# Altium schematic sheet RS485_RS232_Sheet.SchDoc
size 420 x 297 mm; SheetNumber: 7; SheetTotal: 9
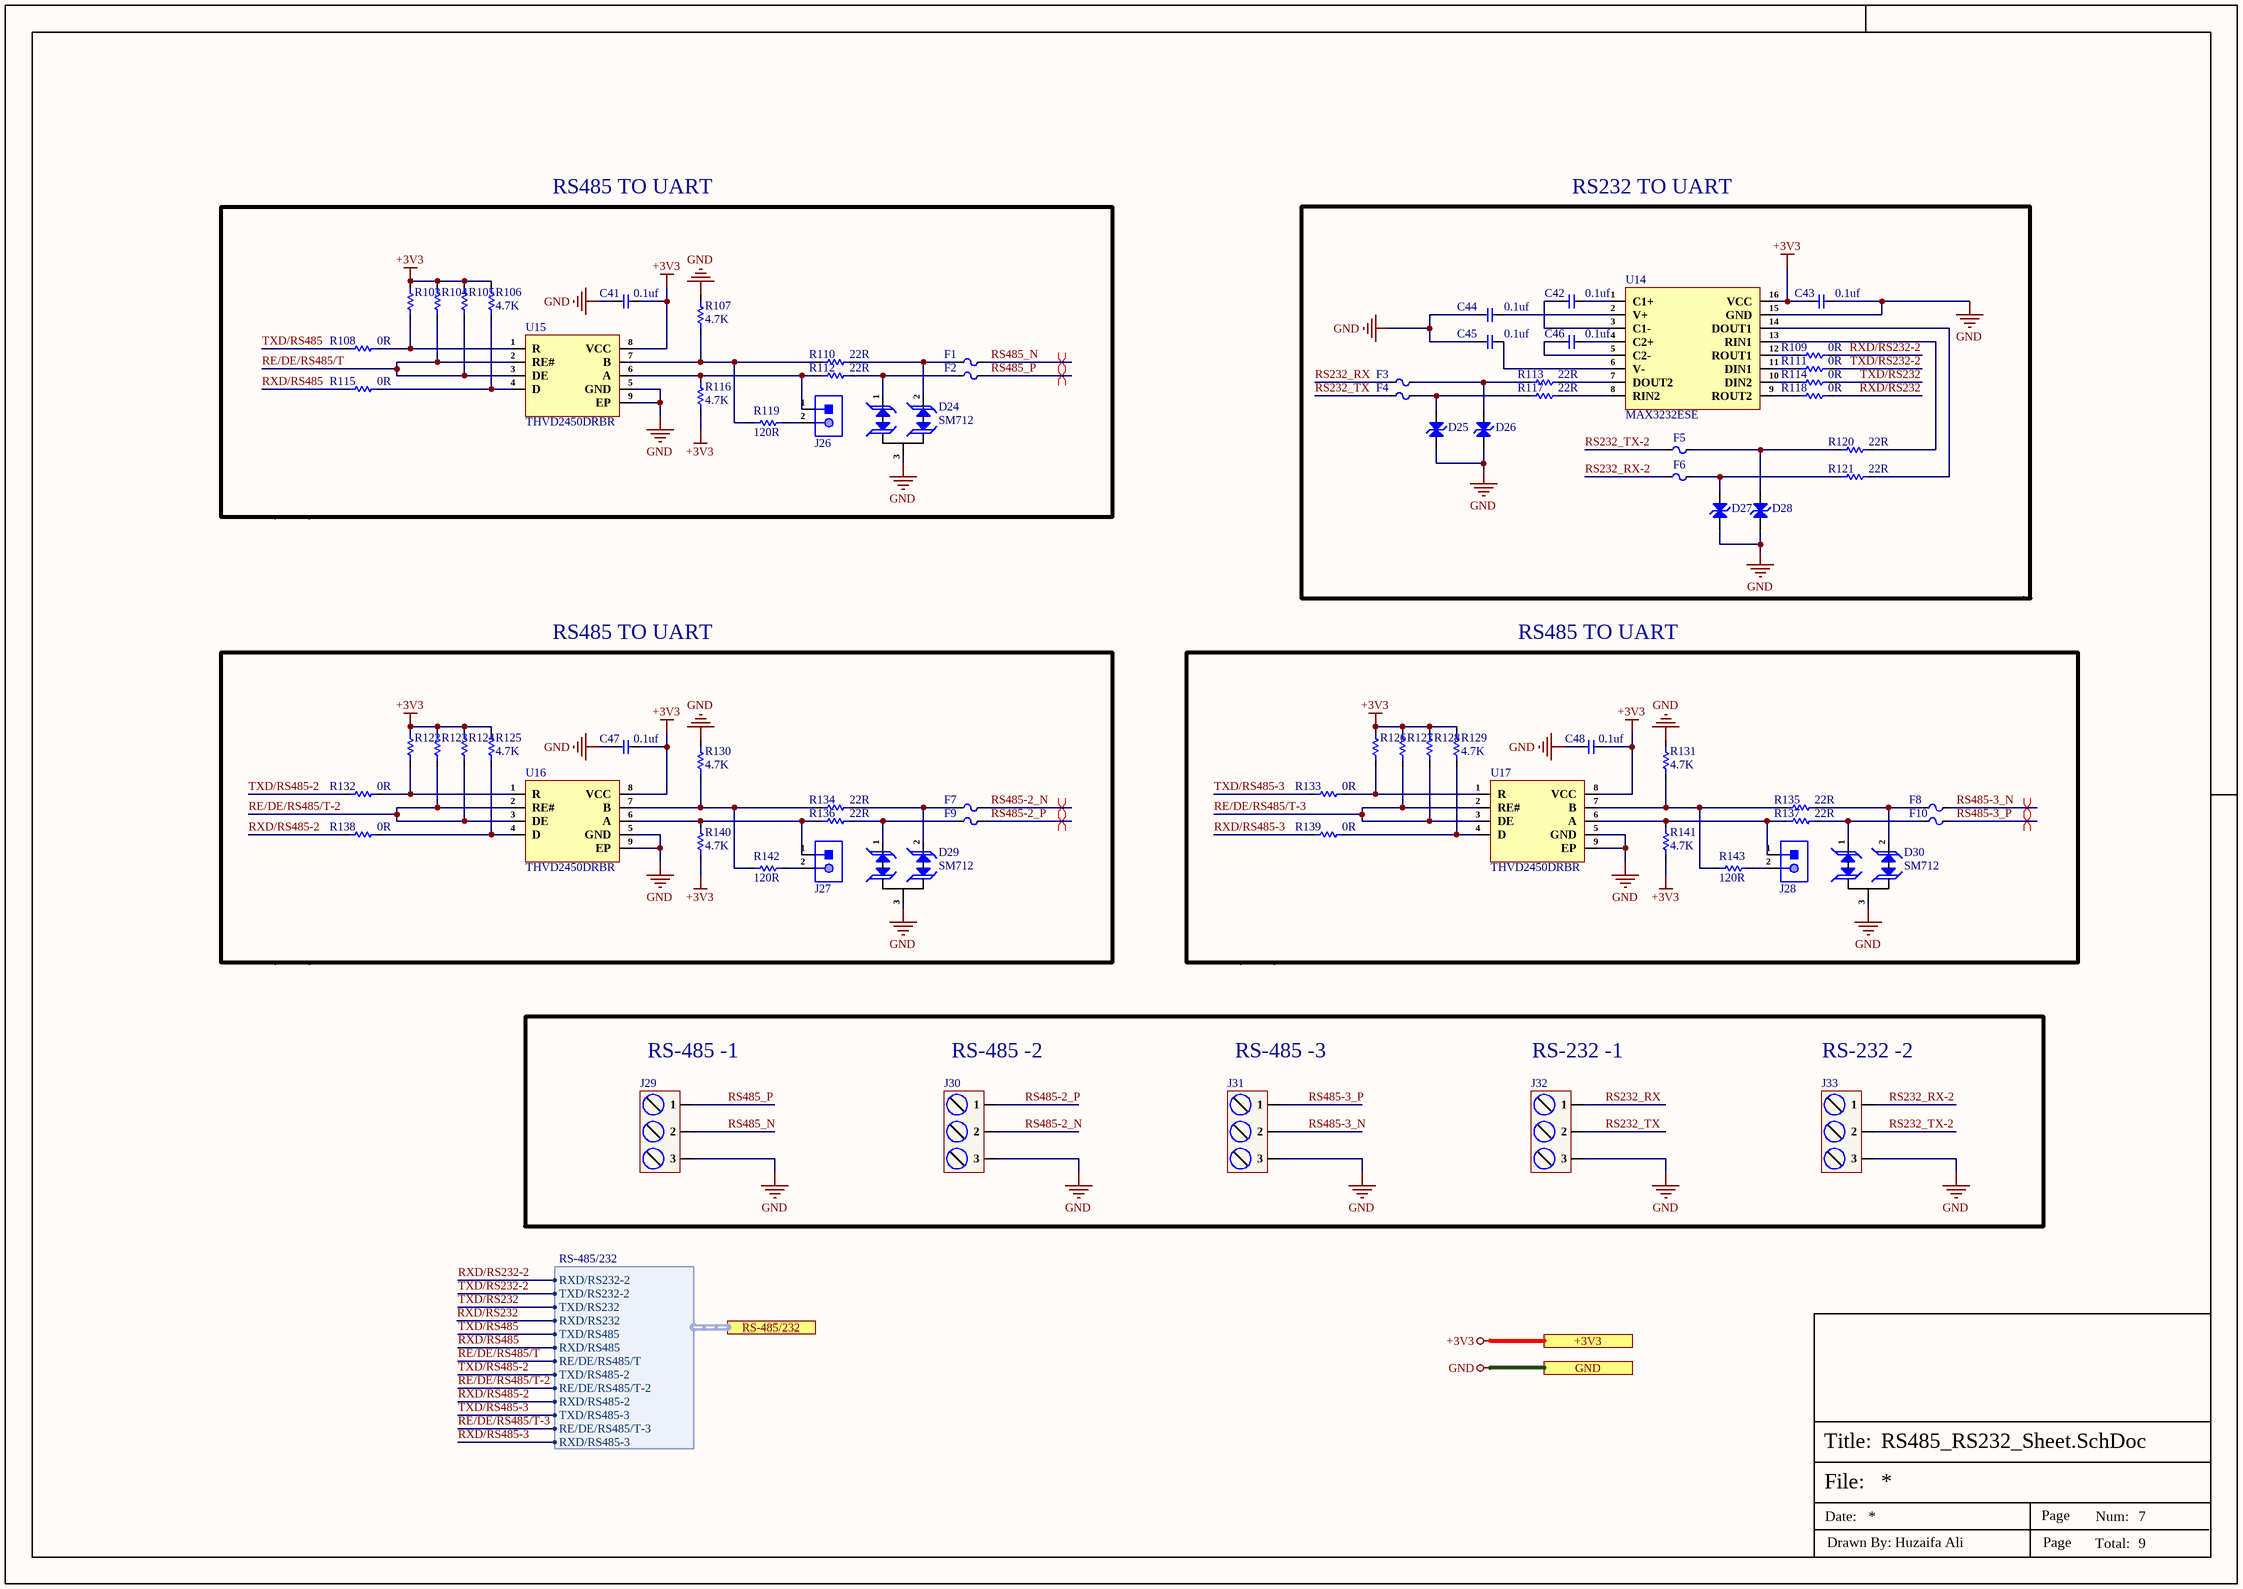
[diagram p0: RS485_RS232_Sheet.SchDoc]

## Parts
C41  0.1uf  [Cap-0402]
C42  0.1uf  [Cap-0402]
C43  0.1uf  [Cap-0402]
C44  0.1uf  [Cap-0402]
C45  0.1uf  [Cap-0402]
C46  0.1uf  [Cap-0402]
C47  0.1uf  [Cap-0402]
C48  0.1uf  [Cap-0402]
D24  SM712  [SOT-23]
D25  SMBJ8.0CA  [SMB Bi Directional]  (value not drawn)
D26  SMBJ8.0CA  [SMB Bi Directional]  (value not drawn)
D27  SMBJ8.0CA  [SMB Bi Directional]  (value not drawn)
D28  SMBJ8.0CA  [SMB Bi Directional]  (value not drawn)
D29  SM712  [SOT-23]
D30  SM712  [SOT-23]
F1  MF-MSMF010-2  [Fuse-1812_]  (value not drawn)
F2  MF-MSMF010-2  [Fuse-1812_]  (value not drawn)
F3  MF-MSMF010-2  [Fuse-1812_]  (value not drawn)
F4  MF-MSMF010-2  [Fuse-1812_]  (value not drawn)
F5  SMD0805P020TF  [Fuse-0805]  (value not drawn)
F6  SMD0805P020TF  [Fuse-0805]  (value not drawn)
F7  MF-MSMF010-2  [Fuse-1812_]  (value not drawn)
F8  MF-MSMF010-2  [Fuse-1812_]  (value not drawn)
F9  MF-MSMF010-2  [Fuse-1812_]  (value not drawn)
F10  MF-MSMF010-2  [Fuse-1812_]  (value not drawn)
J26  X6511WV-02H-C60D30  [HDR1X2_]  (value not drawn)
J27  X6511WV-02H-C60D30  [HDR1X2_]  (value not drawn)
J28  X6511WV-02H-C60D30  [HDR1X2_]  (value not drawn)
J29  DB128L-5.08-3P-BK-S  [DB128L-5.08-3P-BK-S]  (value not drawn)
J30  DB128L-5.08-3P-BK-S  [DB128L-5.08-3P-BK-S]  (value not drawn)
J31  DB128L-5.08-3P-BK-S  [DB128L-5.08-3P-BK-S]  (value not drawn)
J32  DB128L-5.08-3P-BK-S  [DB128L-5.08-3P-BK-S]  (value not drawn)
J33  DB128L-5.08-3P-BK-S  [DB128L-5.08-3P-BK-S]  (value not drawn)
R103  4.7K  [Res-0402]  (value not drawn)
R104  4.7K  [Res-0402]  (value not drawn)
R105  4.7K  [Res-0402]  (value not drawn)
R106  4.7K  [Res-0402]
R107  4.7K  [Res-0402]
R108  0R  [Res-0402]
R109  0R  [Res-0402]
R110  22R  [Res-0201]
R111  0R  [Res-0402]
R112  22R  [Res-0201]
R113  22R  [Res-0201]
R114  0R  [Res-0402]
R115  0R  [Res-0402]
R116  4.7K  [Res-0402]
R117  22R  [Res-0201]
R118  0R  [Res-0402]
R119  120R  [Res-0603]
R120  22R  [Res-0201]
R121  22R  [Res-0201]
R122  4.7K  [Res-0402]  (value not drawn)
R123  4.7K  [Res-0402]  (value not drawn)
R124  4.7K  [Res-0402]  (value not drawn)
R125  4.7K  [Res-0402]
R126  4.7K  [Res-0402]  (value not drawn)
R127  4.7K  [Res-0402]  (value not drawn)
R128  4.7K  [Res-0402]  (value not drawn)
R129  4.7K  [Res-0402]
R130  4.7K  [Res-0402]
R131  4.7K  [Res-0402]
R132  0R  [Res-0402]
R133  0R  [Res-0402]
R134  22R  [Res-0201]
R135  22R  [Res-0201]
R136  22R  [Res-0201]
R137  22R  [Res-0201]
R138  0R  [Res-0402]
R139  0R  [Res-0402]
R140  4.7K  [Res-0402]
R141  4.7K  [Res-0402]
R142  120R  [Res-0603]
R143  120R  [Res-0603]
U14  MAX3232ESE  [SOP-16]
U15  THVD2450DRBR  [SON-8-EP(3x3)]
U16  THVD2450DRBR  [SON-8-EP(3x3)]
U17  THVD2450DRBR  [SON-8-EP(3x3)]

## Ports
+3V3 (see Top-Sheet[5B], CAN_Sheet[5D], ESP32_Sheet[5D], EtherCAT_Sheet[5D], Ethernet_Sheet[5D], Power_Sheet[5D], STM32_Sheet[5D], TFT_Display_Sheet[5D]), GND (see Top-Sheet[5B], CAN_Sheet[5D], ESP32_Sheet[5D], EtherCAT_Sheet[5D], Ethernet_Sheet[5D], Power_Sheet[5D], STM32_Sheet[5D], TFT_Display_Sheet[5D]), RS-485/232 (harness RS-485/232, see Top-Sheet[5B], STM32_Sheet[2D])

## Harnesses
RS-485/232: TXD/RS232, RXD/RS232, TXD/RS485, RXD/RS485, RE/DE/RS485/T, TXD/RS485-2, RE/DE/RS485/T-2, RXD/RS485-2, TXD/RS232-2, RXD/RS232-2, TXD/RS485-3, RE/DE/RS485/T-3, RXD/RS485-3

## Nets
+3V3: C41.2 C43.2 C47.2 C48.2 R103.2 R104.2 R105.2 R106.2 R116.1 R122.2 R123.2 R124.2 R125.2 R126.2 R127.2 R128.2 R129.2 R140.1 R141.1 U14.16(VCC) U15.8(VCC) U16.8(VCC) U17.8(VCC) ; port +3V3
GND: C41.1 C43.1 C44.1 C45.1 C47.1 C48.1 D24.3(GND) D25.1(A) D26.1(A) D27.1(A) D28.1(A) D29.3(GND) D30.3(GND) J29.3 J30.3 J31.3 J32.3 J33.3 R107.2 R130.2 R131.2 U14.15(GND) U15.5(GND) U15.9(EP) U16.5(GND) U16.9(EP) U17.5(GND) U17.9(EP) ; port GND
RE/DE/RS485/T: R104.1 R105.1 U15.2(RE#) U15.3(DE) ; port RS-485/232.RE/DE/RS485/T
RE/DE/RS485/T-2: R123.1 R124.1 U16.2(RE#) U16.3(DE) ; port RS-485/232.RE/DE/RS485/T-2
RE/DE/RS485/T-3: R127.1 R128.1 U17.2(RE#) U17.3(DE) ; port RS-485/232.RE/DE/RS485/T-3
RS232_RX: F3.1 J32.1
RS232_RX-2: F6.1 J33.1
RS232_TX: F4.1 J32.2
RS232_TX-2: F5.1 J33.2
RS485-2_N: F7.2 J30.2
RS485-2_P: F9.2 J30.1
RS485-3_N: F8.2 J31.2
RS485-3_P: F10.2 J31.1
RS485_N: F1.2 J29.2
RS485_P: F2.2 J29.1
RXD/RS232: R118.2 ; port RS-485/232.RXD/RS232
RXD/RS232-2: R109.2 ; port RS-485/232.RXD/RS232-2
RXD/RS485: R115.1 ; port RS-485/232.RXD/RS485
RXD/RS485-2: R138.1 ; port RS-485/232.RXD/RS485-2
RXD/RS485-3: R139.1 ; port RS-485/232.RXD/RS485-3
TXD/RS232: R114.2 ; port RS-485/232.TXD/RS232
TXD/RS232-2: R111.2 ; port RS-485/232.TXD/RS232-2
TXD/RS485: R108.1 ; port RS-485/232.TXD/RS485
TXD/RS485-2: R132.1 ; port RS-485/232.TXD/RS485-2
TXD/RS485-3: R133.1 ; port RS-485/232.TXD/RS485-3
NetC42_1: C42.1 U14.1(C1+)
NetC42_2: C42.2 U14.3(C1-)
NetC44_2: C44.2 U14.2(V+)
NetC45_2: C45.2 U14.6(V-)
NetC46_1: C46.1 U14.4(C2+)
NetC46_2: C46.2 U14.5(C2-)
NetD24_1: D24.1(I/O1) F2.1 R112.2
NetD24_2: D24.2(I/O2) F1.1 R110.2
NetD25_2: D25.2(A) F4.2 R117.1
NetD26_2: D26.2(A) F3.2 R113.1
NetD27_2: D27.2(A) F6.2 R121.1
NetD28_2: D28.2(A) F5.2 R120.1
NetD29_1: D29.1(I/O1) F9.1 R136.2
NetD29_2: D29.2(I/O2) F7.1 R134.2
NetD30_1: D30.1(I/O1) F10.1 R137.2
NetD30_2: D30.2(I/O2) F8.1 R135.2
NetJ26_1: J26.1 R112.1 R116.2 U15.6(A)
NetJ26_2: J26.2 R119.2
NetJ27_1: J27.1 R136.1 R140.2 U16.6(A)
NetJ27_2: J27.2 R142.2
NetJ28_1: J28.1 R137.1 R141.2 U17.6(A)
NetJ28_2: J28.2 R143.2
NetR103_1: R103.1 R108.2 U15.1(R)
NetR106_1: R106.1 R115.2 U15.4(D)
NetR107_1: R107.1 R110.1 R119.1 U15.7(B)
NetR109_1: R109.1 U14.12(ROUT1)
NetR111_1: R111.1 U14.11(DIN1)
NetR113_2: R113.2 U14.7(DOUT2)
NetR114_1: R114.1 U14.10(DIN2)
NetR117_2: R117.2 U14.8(RIN2)
NetR118_1: R118.1 U14.9(ROUT2)
NetR120_2: R120.2 U14.13(RIN1)
NetR121_2: R121.2 U14.14(DOUT1)
NetR122_1: R122.1 R132.2 U16.1(R)
NetR125_1: R125.1 R138.2 U16.4(D)
NetR126_1: R126.1 R133.2 U17.1(R)
NetR129_1: R129.1 R139.2 U17.4(D)
NetR130_1: R130.1 R134.1 R142.1 U16.7(B)
NetR131_1: R131.1 R135.1 R143.1 U17.7(B)

## Layout directives
differential pair; net class RS485; differential pair class RS485_LINES; rule Impedance Constraint [Min = 115.0    Max = 125.0    ]; rule Matched Net Lengths [Tolerance = 0.508mm]: RS485-2_N, RS485-2_P, RS485-3_N, RS485-3_P, RS485_N, RS485_P

## Notes on the sheet
- RS485 TO UART
- RS232 TO UART
- (near J29) RS-485 -1
- (near J30) RS-485 -2
- (near J31) RS-485 -3
- (near J32) RS-232 -1
- (near J33) RS-232 -2
- File:
- Title:
- Date:
- Page
- Num:
- Total:
- Drawn By: Huzaifa Ali

## Library data of the parts
C41-C48 = GRM155R62A104KE14D: CAP CER 0.1UF 100V X5R 0402; Manufacturer: Murata; Capacitance: 100nF; Tolerance: 10%; Item Type: Capacitor; Supplier 1: Arrow Electronics; Manufacturer Part Number: GRM155R62A104KE14D; RoHS: Yes; Category: Ceramic Capacitors; Stock 1: 870000; Pricing 1: 10000=0.00500, 20000=0.00410, 30000=0.00390, 50000=0.00370, 100000=0.00300 (USD); Mount: Surface Mount; Case/Package: 0402; Case Code (Metric): 1005; Case Code (Imperial): 0402; Weight: 0.000212oz; Min Operating Temperature: -55°C; Max Operating Temperature: 85°C; Packaging: Tape and Reel; Voltage Rating: 100V; Dielectric: X5R; Termination: SMD/SMT; Voltage Rating (DC): 100V; Package Quantity: 10000; Series: GRM; Length: 0.039inch; Width: 0.02inch; Height: 0.5mm; Thickness: 0.022inch; Reach SVHC Compliant: Yes; Lead Free: Lead Free; RoHS Compliant: Yes; ComponentLink1URL: http://www.farnell.com/datasheets/2079151.pdf?src-supplier=Farnell; ComponentLink1Description: http://www.farnell.com/datasheets/2079151.pdf?src-supplier=Farnell; ComponentLink2URL: http://www.mouser.com/ds/2/281/c02e-2905.pdf?src-supplier=Mouser; ComponentLink2Description: http://www.mouser.com/ds/2/281/c02e-2905.pdf?src-supplier=Mouser; ComponentLink3URL: http://www.farnell.com/datasheets/2079151.pdf?src-supplier=Element14; ComponentLink3Description: http://www.farnell.com/datasheets/2079151.pdf?src-supplier=Element14; ComponentLink4URL: http://search.murata.co.jp/Ceramy/image/img/A01X/G101/ENG/GRM155R62A104KE14-01.pdf?src-supplier=Digi-Key; ComponentLink4Description: http://search.murata.co.jp/Ceramy/image/img/A01X/G101/ENG/GRM155R62A104KE14-01.pdf?src-supplier=Digi-Key; ComponentLink5URL: http://www.farnell.com/datasheets/2079151.pdf?src-supplier=Newark; ComponentLink5Description: http://www.farnell.com/datasheets/2079151.pdf?src-supplier=Newark; Supplier Part Number 1: GRM155R62A104KE14D; LCSC Part Number: C162178
D24 D29 D30 = SM712: SOT-23 TVS ROHS; Manufacturer: TECH PUBLIC; Item Type: Diode; Manufacturer Part Number: SM712; Package: SOT-23; LCSC Part Number: C521963; ComponentLink1Description: LCSC; ComponentLink1URL: https://www.lcsc.com/product-detail/TVS_TECH-PUBLIC-SM712_C521963.html
D25-D28 = SMBJ8.0CA: TVS DIODE 8VWM 13.6VC DO214AA; Manufacturer: Littelfuse; Item Type: TVS Diodes; Peak Pulse Power: 600W; Clamping Voltage: 13.6V; Reverse Standoff Voltage: 8V; Peak Pulse Current: 44.2A; Test Current: 1mA; Polarity: Bidirectional; Number of Bidirectional Channels: 1; Min Breakdown Voltage: 8.89V; Power Line Protection: No; Leakage Current: 100uA; Diode Type: ZENER; Max Breakdown Voltage: 9.83V; Supplier: Digikey; LCSC Part Number: C224029; Manufacturer Part Number: SMBJ8.0CA; RoHS: Yes; Stock: 5825; Pricing: 1=0.52, 10=0.321, 100=0.2038, 500=0.15312, 1000=0.13674 (USD); Mounting Technology: Surface Mount; Case/Package: DO-214AA; Pins: 2; Min Operating Temperature: -65°C; Max Operating Temperature: 150°C; Packaging: Cut Tape; Reverse Breakdown Voltage: 8.89V; Number of Elements: 1; Series: SMBJ; Direction: Bidirectional; Voltage Rating (DC): 8V; Max Power Dissipation: 600W; Power Dissipation: 600W; Clamping Voltage-Max: 13.6V; Length: 5.59mm; Width: 3.94mm; Height: 2.44mm; RoHS Compliant: Yes; Lead Free: Lead Free; Reach SVHC Compliant: No; ComponentLink1URL: https://datasheet.ciiva.com/8062/littelfuse-tvs-diode-smbj-8062558.pdf?src-supplier=Element14; ComponentLink1Description: https://datasheet.ciiva.com/8062/littelfuse-tvs-diode-smbj-8062558.pdf?src-supplier=Element14; ComponentLink2URL: https://datasheet.ciiva.com/331/littelfuse-tvs-diode-smbj-datasheet-pdf-331629.pdf?src-supplier=Digikey; ComponentLink2Description: https://datasheet.ciiva.com/331/littelfuse-tvs-diode-smbj-datasheet-pdf-331629.pdf?src-supplier=Digikey; ComponentLink3URL: https://datasheet.ciiva.com/331/littelfuse-tvs-diode-smbj-datasheet-pdf-331630.pdf?src-supplier=Digikey; ComponentLink3Description: https://datasheet.ciiva.com/331/littelfuse-tvs-diode-smbj-datasheet-pdf-331630.pdf?src-supplier=Digikey; ComponentLink4URL: https://datasheet.ciiva.com/331/littelfuse-tvs-diode-smbj-datasheet-pdf-331628.pdf?src-supplier=Digikey; ComponentLink4Description: https://datasheet.ciiva.com/331/littelfuse-tvs-diode-smbj-datasheet-pdf-331628.pdf?src-supplier=Digikey
F1-F4 F7-F10 = MF-MSMF010-2: 60V 100mA 40A 300mA 1812 Resettable Fuses ROHS; Manufacturer: Bourns; Time to Trip: 1.5s; Item Type: Fuse; Supplier 1: Arrow Electronics; Manufacturer Part Number: MF-MSMF010-2; RoHS: Yes; Category: Fuses; Stock 1: 75000; Pricing 1: 3000=0.1392 (USD); Mounting Technology: Surface Mount; Case Code (Imperial): 1812; Case Code (Metric): 4532; Min Operating Temperature: -40°C; Max Operating Temperature: 85°C; Packaging: Cut Tape; Max Current Rating: 40A; Hold Current: 100mA; Trip Current: 300mA; Series: Multifuse®, MF-MSMF; Voltage Rating: 60V; Ratings: AEC-Q200; RoHS Compliant: Yes; ComponentLink1URL: http://www.farnell.com/datasheets/2264697.pdf?src-supplier=Farnell; ComponentLink1Description: http://www.farnell.com/datasheets/2264697.pdf?src-supplier=Farnell; ComponentLink2URL: http://www.farnell.com/datasheets/2264697.pdf?src-supplier=Newark; ComponentLink2Description: http://www.farnell.com/datasheets/2264697.pdf?src-supplier=Newark; ComponentLink3URL: http://www.farnell.com/datasheets/2264697.pdf?src-supplier=Element14; ComponentLink3Description: http://www.farnell.com/datasheets/2264697.pdf?src-supplier=Element14; ComponentLink4URL: http://www.farnell.com/datasheets/1786007.pdf?src-supplier=Newark; ComponentLink4Description: http://www.farnell.com/datasheets/1786007.pdf?src-supplier=Newark; ComponentLink5URL: https://www.bourns.com/docs/Product-Datasheets/mfmsmf.pdf?src-supplier=Digi-Key; ComponentLink5Description: https://www.bourns.com/docs/Product-Datasheets/mfmsmf.pdf?src-supplier=Digi-Key; Supplier Part Number 1: MF-MSMF010-2; LCSC Part Number: C12430
F5 F6 = SMD0805P020TF: 9V 200mA 100A 500mA 0805 Resettable Fuses ROHS; Manufacturer: RUILON; Item Type: Fuse; Manufacturer Part Number: SMD0805P020TF; Package: 0805; LCSC Part Number: C20976; ComponentLink1Description: LCSC; ComponentLink1URL: https://www.lcsc.com/product-detail/Resettable-Fuses_RUILON-Shenzhen-Ruilongyuan-Elec-SMD0805P020TF_C20976.html
J26-J28 = X6511WV-02H-C60D30: Gold 250V 3A Straight Square Pins 2.5mm 2P 260℃ 6mm -40℃~+105℃ 3mm 2.54mm Plugin Black Brass 1x2P Plugin,P=2.54mm Pin Headers ROHS; Manufacturer: XKB; Item Type: Male Header; Manufacturer Part Number: X6511WV-02H-C60D30; Package: Plugin,P=2.54mm; LCSC Part Number: C706874; ComponentLink1Description: LCSC; ComponentLink1URL: https://www.lcsc.com/product-detail/Pin-Headers_XKB-Connectivity-X6511WV-02H-C60D30_C706874.html
J29-J33 = DB128L-5.08-3P-BK-S: 1x3P 18A -40℃~+105℃ 250V Black 12~30 Straight pin 5.08mm 2.5 1 3 Plugin,P=5.08mm Screw terminal ROHS; Manufacturer: DIBO; Item Type: Terminal Block; Manufacturer Part Number: DB128L-5.08-3P-BK-S; Package: Plugin,P=5.08mm; LCSC Part Number: C430602; ComponentLink1Description: LCSC; ComponentLink1URL: https://www.lcsc.com/product-detail/Screw-terminal_DIBO-DB128L-5-08-3P-BK-S_C430602.html
R103-R107 R116 R122-R131 R140 R141 = RC0402FR-074K7L: RES 4.7K OHM 1% 1/16W 0402; Manufacturer: Yageo; Voltage Rating (DC): 50V; Power Rating: 62.5mW; Resistance: 4.7kR; Temperature Coefficient: 100ppm/°C; Max Power Dissipation: 63mW; Item Type: Resistor; Supplier 1: Avnet; Manufacturer Part Number: RC0402FR-074K7L; RoHS: Yes; Category: Chip SMD Resistors; Stock 1: 2420000; Pricing 1: 10000=0.00085 (USD); Case/Package: 0402; Number of Pins: 2; Case Code (Imperial): 0402; Case Code (Metric): 1005; Size Code: 0402; Min Operating Temperature: -55°C; Max Operating Temperature: 155°C; Tolerance: 1%; Voltage Rating: 50V; Packaging: Tape and Reel; Resistor Type: Thick Film; Termination: SMD/SMT; Features: Moisture Resistant; Series: RC; Number of Terminations: 2; Resistance Tolerance: 1%; Construction: Rectangular; Length: 1mm; Width: 0.5mm; Height: 0.32mm; Depth: 0.5mm; Height - Seated (Max): 0.016inch; RoHS Compliant: Yes; Reach SVHC Compliant: Yes; Military Standard: Not; Lead Free: Lead Free; ComponentLink1URL: https://datasheet.ciiva.com/22661/1686128-22661342.pdf?src-supplier=Element14; ComponentLink1Description: https://datasheet.ciiva.com/22661/1686128-22661342.pdf?src-supplier=Element14; ComponentLink2URL: https://datasheet.ciiva.com/7850/1018594-7850022.pdf?src-supplier=Element14; ComponentLink2Description: https://datasheet.ciiva.com/7850/1018594-7850022.pdf?src-supplier=Element14; ComponentLink3URL: https://datasheet.ciiva.com/7850/1018594-7850023.pdf?src-supplier=Element14; ComponentLink3Description: https://datasheet.ciiva.com/7850/1018594-7850023.pdf?src-supplier=Element14; ComponentLink4URL: https://datasheet.ciiva.com/15215/getdatasheetpartid-328119-15215035.pdf?src-supplier=Verical; ComponentLink4Description: https://datasheet.ciiva.com/15215/getdatasheetpartid-328119-15215035.pdf?src-supplier=Verical; Supplier Part Number 1: RC0402FR-074K7L; LCSC Part Number: C105871
R108 R109 R111 R114 R115 R118 R132 R133 R138 R139 = RC0402FR-070RL: RES 0 OHM JUMPER 1/16W 0402; Manufacturer: Yageo; Item Type: Resistors; Tolerance: 1%; Power Rating: 62.5mW; Voltage Rating: 50V; Temperature Coefficient: 200ppm/°C; Max Power Dissipation: 63mW; Supplier 1: Mouser; Manufacturer Part Number: RC0402FR-070RL; RoHS: Yes; Stock 1: 8556842; Pricing 1: 1=0.10000, 10=0.01400, 50=0.01400, 100=0.00600, 1000=0.00300, 5000=0.00200, 10000=0.00100 (USD); Mount: Surface Mount; Case/Package: 0402; Contact Plating: Tin,Matte; Case Code (Imperial): 0402; Case Code (Metric): 1005; Size Code: 0402; Min Operating Temperature: -55°C; Max Operating Temperature: 155°C; Resistance: 0R; Resistor Type: Thick Film; Packaging: Tape and Reel; Termination: SMD/SMT; Features: Moisture Resistant; Series: RC; Number of Terminations: 2; Length: 1mm; Width: 0.5mm; Height: 0.35mm; Radiation Hardening: No; Lead Free: Lead Free; RoHS Compliant: Yes; ComponentLink1URL: https://datasheet.ciiva.com/8896/pyu-rc0402-51-rohs-l-6-8896149.pdf?src-supplier=Avnet; ComponentLink1Description: https://datasheet.ciiva.com/8896/pyu-rc0402-51-rohs-l-6-8896149.pdf?src-supplier=Avnet; ComponentLink2URL: https://datasheet.ciiva.com/16790/pyu-rc0402-51-rohs-l-6-r-16790444.pdf?src-supplier=Future+Electronics; ComponentLink2Description: https://datasheet.ciiva.com/16790/pyu-rc0402-51-rohs-l-6-r-16790444.pdf?src-supplier=Future+Electronics; Supplier Part Number 1: 603-RC0402FR-070RL; LCSC Part Number: C106231
R110 R112 R113 R117 R120 R121 R134-R137 = RC0201FR-0722RL: RES 22 OHM 1% 1/20W 0201; Manufacturer: Yageo; Item Type: Resistor; Supplier: Future Electronics; Supplier Part Number: 5973409; Manufacturer Part Number: RC0201FR-0722RL; RoHS: Yes; Category: Chip SMD Resistors; Stock: 17980000; Pricing: 10000=0.0014, 50000=0.0013, 250000=0.0013, 750000=0.0012, 2000000=0.0011 (USD); ComponentLink1URL: https://datasheet.ciiva.com/7672/1563626-7672215.pdf?src-supplier=Element14; ComponentLink1Description: https://datasheet.ciiva.com/7672/1563626-7672215.pdf?src-supplier=Element14; LCSC Part Number: C155743
R119 R142 R143 = RC0603JR-07120RL: RES 120 OHM 5% 1/10W 0603; Manufacturer: Yageo; Voltage Rating (AC): 50V; Item Type: Resistor; Supplier: Future Electronics; Supplier Part Number: 4045720; Manufacturer Part Number: RC0603JR-07120RL; RoHS: Yes; Category: Chip SMD Resistors; Stock: 570000; Pricing: 5000=0.0015, 75000=0.0015, 250000=0.0014, 750000=0.0013, 2500000=0.0012 (USD); ComponentLink1URL: https://datasheet.ciiva.com/15189/getdatasheetpartid-326532-15189850.pdf?src-supplier=Verical; ComponentLink1Description: https://datasheet.ciiva.com/15189/getdatasheetpartid-326532-15189850.pdf?src-supplier=Verical; ComponentLink2URL: https://datasheet.ciiva.com/2518/pyu-r-int-thick-7-2518850.pdf?src-supplier=Digi-Key; ComponentLink2Description: https://datasheet.ciiva.com/2518/pyu-r-int-thick-7-2518850.pdf?src-supplier=Digi-Key; ComponentLink3URL: https://datasheet.ciiva.com/2518/pyu-r-int-thick-7-2518851.pdf?src-supplier=Digi-Key; ComponentLink3Description: https://datasheet.ciiva.com/2518/pyu-r-int-thick-7-2518851.pdf?src-supplier=Digi-Key; ComponentLink4URL: https://datasheet.ciiva.com/2518/pyu-r-int-thick-7-2518852.pdf?src-supplier=Digi-Key; ComponentLink4Description: https://datasheet.ciiva.com/2518/pyu-r-int-thick-7-2518852.pdf?src-supplier=Digi-Key; ComponentLink5URL: https://datasheet.ciiva.com/46395/443971-46395070.pdf?src-supplier=Element14; ComponentLink5Description: https://datasheet.ciiva.com/46395/443971-46395070.pdf?src-supplier=Element14; ComponentLink6URL: https://datasheet.ciiva.com/12555/rc0603-272842-12555246.pdf?src-supplier=Mouser; ComponentLink6Description: https://datasheet.ciiva.com/12555/rc0603-272842-12555246.pdf?src-supplier=Mouser; LCSC Part Number: C114681
U14 = MAX3232ESE: 250Kbps transceiver 2/2 SOP-16 RS232 ICs ROHS; Manufacturer: UMW; Item Type: IC; Manufacturer Part Number: MAX3232ESE; Package: SOP-16; LCSC Part Number: C2904738; ComponentLink1Description: LCSC; ComponentLink1URL: https://www.lcsc.com/product-detail/RS232-ICs_UMW-Youtai-Semiconductor-Co-Ltd-MAX3232ESE_C2904738.html
U15-U17 = THVD2450DRBR: IC TRANSCEIVER HALF 1/1 8SON; Manufacturer: Texas Instruments; Supplier: Digikey; Supplier Part Number: 296-THVD2450DRBRCT-ND; Manufacturer Part Number: THVD2450DRBR; RoHS: Yes; Item Type: IC; Stock: 2652; Pricing: 1=4.05, 10=3.639, 25=3.4404, 100=2.9818, 250=2.82892, 500=2.53838, 1000=2.1408 (USD); Pins: 8NUMBER; Length: 3mm; Width: 3mm; Height: 1mm; Thickness: 880um; LCSC Part Number: C2878080